# EAGLE design v6845-b (EAGLE 4.13)
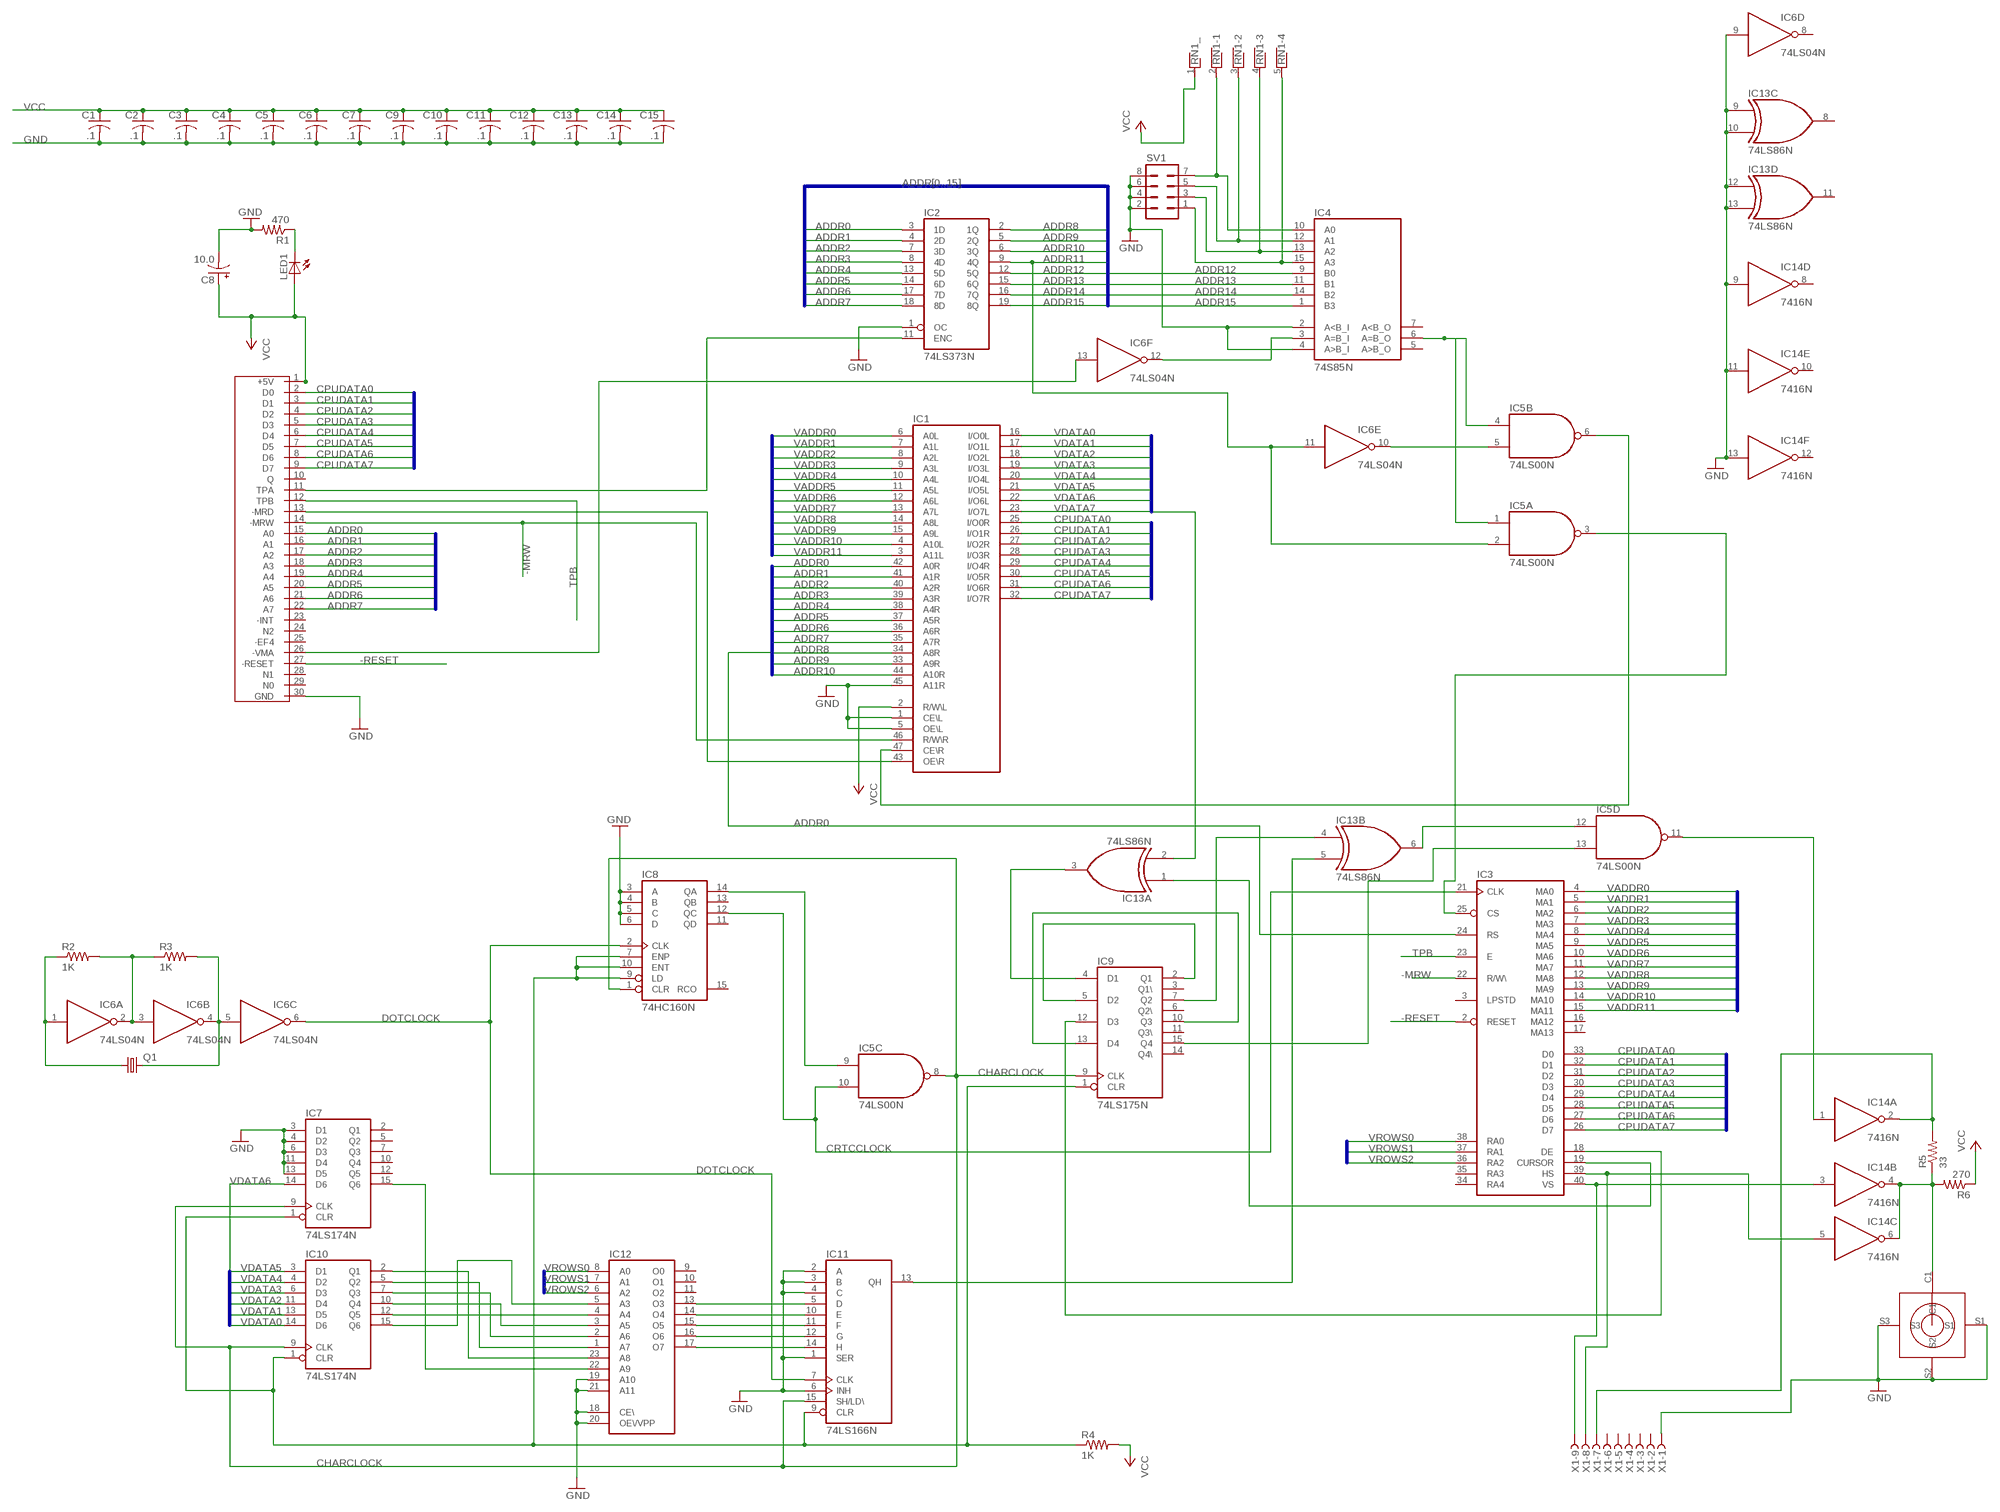
[diagram p0: schematic, sheet 1]

## Parts
C1  .1  C-US025-050X050  [C025-050X050]
C2  .1  C-US025-050X050  [C025-050X050]
C3  .1  C-US025-050X050  [C025-050X050]
C4  .1  C-US025-050X050  [C025-050X050]
C5  .1  C-US025-050X050  [C025-050X050]
C6  .1  C-US025-050X050  [C025-050X050]
C7  .1  C-US025-050X050  [C025-050X050]
C8  10.0  CPOL-USE2.5-7  [E2,5-7]
C9  .1  C-US025-050X050  [C025-050X050]
C10  .1  C-US025-050X050  [C025-050X050]
C11  .1  C-US025-050X050  [C025-050X050]
C12  .1  C-US025-050X050  [C025-050X050]
C13  .1  C-US025-050X050  [C025-050X050]
C14  .1  C-US025-050X050  [C025-050X050]
C15  .1  C-US025-050X050  [C025-050X050]
IC1  7134P  [DIL48]
IC2  74LS373N  [DIL20]
IC3  6845  [DIL40]
IC4  74S85N  [DIL16]
IC5  74LS00N  [DIL14]
IC6  74LS04N  [DIL14]
IC7  74LS174N  [DIL16]
IC8  74HC160N  [DIL16]
IC9  74LS175N  [DIL16]
IC10  74LS174N  [DIL16]
IC11  74LS166N  [DIL16]
IC12  2732  [DIL24]
IC13  74LS86N  [DIL14]
IC14  7416N  [DIL14]
LED1  LED5MM  [LED5MM]
Q1  CRYTALHC49U-V  [HC49U-V]
R1  470  R-US_0207/7  [0207/7]
R2  1K  R-US_0207/7  [0207/7]
R3  1K  R-US_0207/7  [0207/7]
R4  1K  R-US_0207/7  [0207/7]
R5  33  R-US_0207/7  [0207/7]
R6  270  R-US_0207/7  [0207/7]
RN1  RNX4  [RN-5]
SV1  MA04-2  [MA04-2]
U$1  C30  [C30]
U$4  RCA  [RCA]
X1  F09HPS  [F09HP]

## Nets
-MRW: IC1.46(R/W\R) IC3.22(R/W\) U$1.14(-MRW)
-RESET: IC3.2(RESET) U$1.27(-RESET)
ADDR0: IC1.42(A0R) IC2.3(1D) IC3.24(RS) U$1.15(A0)
ADDR1: IC1.41(A1R) IC2.4(2D) U$1.16(A1)
ADDR2: IC1.40(A2R) IC2.7(3D) U$1.17(A2)
ADDR3: IC1.39(A3R) IC2.8(4D) U$1.18(A3)
ADDR4: IC1.38(A4R) IC2.13(5D) U$1.19(A4)
ADDR5: IC1.37(A5R) IC2.14(6D) U$1.20(A5)
ADDR6: IC1.36(A6R) IC2.17(7D) U$1.21(A6)
ADDR7: IC1.35(A7R) IC2.18(8D) U$1.22(A7)
ADDR8: IC1.34(A8R) IC2.2(1Q)
ADDR9: IC1.33(A9R) IC2.5(2Q)
ADDR10: IC1.44(A10R) IC2.6(3Q)
ADDR11: IC2.9(4Q) IC5.2(A:I1) IC6.11(E:I)
ADDR12: IC2.12(5Q) IC4.9(B0)
ADDR13: IC2.15(6Q) IC4.11(B1)
ADDR14: IC2.16(7Q) IC4.14(B2)
ADDR15: IC2.19(8Q) IC4.1(B3)
CHARCLOCK: IC5.8(C:O) IC7.9(CLK) IC8.1(CLR) IC9.9(CLK) IC10.9(CLK) IC11.15(SH/LD\)
CPUDATA0: IC1.25(I/O0R) IC3.33(D0) U$1.2(D0)
CPUDATA1: IC1.26(I/O1R) IC3.32(D1) U$1.3(D1)
CPUDATA2: IC1.27(I/O2R) IC3.31(D2) U$1.4(D2)
CPUDATA3: IC1.28(I/O3R) IC3.30(D3) U$1.5(D3)
CPUDATA4: IC1.29(I/O4R) IC3.29(D4) U$1.6(D4)
CPUDATA5: IC1.30(I/O5R) IC3.28(D5) U$1.7(D5)
CPUDATA6: IC1.31(I/O6R) IC3.27(D6) U$1.8(D6)
CPUDATA7: IC1.32(I/O7R) IC3.26(D7) U$1.9(D7)
CRTCCLOCK: IC3.21(CLK) IC5.10(C:I1) IC8.12(QC)
DOTCLOCK: IC6.6(C:O) IC8.2(CLK) IC11.7(CLK)
GND: C1.2 C2.2 C3.2 C4.2 C5.2 C6.2 C7.2 C8.- C9.2 C10.2 C11.2 C12.2 C13.2 C14.2 C15.2 IC1.1(CE\L) IC1.5(OE\L) IC1.45(A11R) IC2.1(OC) IC4.2(A<B_I) IC4.4(A>B_I) IC6.9(D:I) IC7.3(D1) IC7.4(D2) IC7.6(D3) IC7.11(D4) IC7.13(D5) IC8.3(A) IC8.4(B) IC8.5(C) IC8.6(D) IC11.1(SER) IC11.2(A) IC11.3(B) IC11.4(C) IC11.6(INH) IC12.18(CE\) IC12.19(A10) IC12.20(OE\/VPP) IC12.21(A11) IC13.9(C:I0) IC13.10(C:I1) IC13.12(D:I0) IC13.13(D:I1) IC14.9(D:I) IC14.11(E:I) IC14.13(F:I) R1.2 SV1.2 SV1.4 SV1.6 SV1.8 U$1.30(GND) U$4.S1 U$4.S2 U$4.S3 X1.1
N$1: IC1.43(OE\R) U$1.13(-MRD)
N$2: IC5.5(B:I1) IC6.10(E:O)
N$3: IC3.25(CS) IC5.3(A:O)
N$4: IC4.10(A0) RN1.2 SV1.7
N$5: IC4.12(A1) RN1.3 SV1.5
N$6: IC4.13(A2) RN1.4 SV1.3
N$7: IC4.15(A3) RN1.5 SV1.1
N$8: IC4.3(A=B_I) IC6.12(F:O)
N$9: IC1.47(CE\R) IC5.6(B:O)
N$10: IC7.1(CLR) IC8.7(ENP) IC8.9(LD) IC8.10(ENT) IC9.1(CLR) IC10.1(CLR) IC11.9(CLR) R4.1
N$11: IC6.4(B:O) IC6.5(C:I) Q1.2 R3.2
N$12: IC6.1(A:I) Q1.1 R2.1
N$13: IC7.15(Q6) IC12.22(A9)
N$14: IC6.2(A:O) IC6.3(B:I) R2.2 R3.1
N$17: IC3.19(CURSOR) IC13.1(A:I0)
N$20: IC5.9(C:I0) IC8.14(QA)
N$21: IC9.4(D1) IC13.3(A:O)
N$22: LED1.K(C) R1.1
N$23: IC9.2(Q1) IC9.5(D2)
N$24: IC11.5(D) IC12.13(O3)
N$25: IC11.10(E) IC12.14(O4)
N$26: IC11.11(F) IC12.15(O5)
N$27: IC11.12(G) IC12.16(O6)
N$28: IC11.14(H) IC12.17(O7)
N$29: IC10.2(Q1) IC12.23(A8)
N$30: IC10.5(Q2) IC12.1(A7)
N$31: IC10.7(Q3) IC12.2(A6)
N$32: IC10.10(Q4) IC12.3(A5)
N$33: IC10.12(Q5) IC12.4(A4)
N$34: IC10.15(Q6) IC12.5(A3)
N$35: IC9.7(Q2) IC13.4(B:I0)
N$36: IC11.13(QH) IC13.5(B:I1)
N$37: IC9.10(Q3) IC9.13(D4)
N$38: IC3.18(DE) IC9.12(D3)
N$39: IC5.12(D:I0) IC13.6(B:O)
N$40: IC5.13(D:I1) IC9.15(Q4)
N$41: IC3.40(VS) IC14.3(B:I) X1.9
N$42: IC3.39(HS) IC14.5(C:I) X1.8
N$43: IC5.11(D:O) IC14.1(A:I)
N$44: IC14.4(B:O) IC14.6(C:O) R5.1 R6.2 U$4.C1
N$45: IC14.2(A:O) R5.2 X1.7
N$46: IC4.6(A=B_O) IC5.1(A:I0) IC5.4(B:I0)
N$47: IC6.13(F:I) U$1.26(-VMA)
TPA: IC2.11(ENC) U$1.11(TPA)
TPB: IC3.23(E) U$1.12(TPB)
VADDR0: IC1.6(A0L) IC3.4(MA0)
VADDR1: IC1.7(A1L) IC3.5(MA1)
VADDR2: IC1.8(A2L) IC3.6(MA2)
VADDR3: IC1.9(A3L) IC3.7(MA3)
VADDR4: IC1.10(A4L) IC3.8(MA4)
VADDR5: IC1.11(A5L) IC3.9(MA5)
VADDR6: IC1.12(A6L) IC3.10(MA6)
VADDR7: IC1.13(A7L) IC3.11(MA7)
VADDR8: IC1.14(A8L) IC3.12(MA8)
VADDR9: IC1.15(A9L) IC3.13(MA9)
VADDR10: IC1.4(A10L) IC3.14(MA10)
VADDR11: IC1.3(A11L) IC3.15(MA11)
VCC: C1.1 C2.1 C3.1 C4.1 C5.1 C6.1 C7.1 C8.+ C9.1 C10.1 C11.1 C12.1 C13.1 C14.1 C15.1 IC1.2(R/W\L) LED1.A R4.2 R6.1 RN1.1 U$1.1(+5V)
VDATA0: IC1.16(I/O0L) IC10.14(D6)
VDATA1: IC1.17(I/O1L) IC10.13(D5)
VDATA2: IC1.18(I/O2L) IC10.11(D4)
VDATA3: IC1.19(I/O3L) IC10.6(D3)
VDATA4: IC1.20(I/O4L) IC10.4(D2)
VDATA5: IC1.21(I/O5L) IC10.3(D1)
VDATA6: IC1.22(I/O6L) IC7.14(D6)
VDATA7: IC1.23(I/O7L) IC13.2(A:I1)
VROWS0: IC3.38(RA0) IC12.8(A0)
VROWS1: IC3.37(RA1) IC12.7(A1)
VROWS2: IC3.36(RA2) IC12.6(A2)
Unconnected: IC3.3(LPSTD) IC3.16(MA12) IC3.17(MA13) IC3.34(RA4) IC3.35(RA3) IC4.5(A>B_O) IC4.7(A<B_O) IC6.8(D:O) IC7.2(Q1) IC7.5(Q2) IC7.7(Q3) IC7.10(Q4) IC7.12(Q5) IC8.11(QD) IC8.13(QB) IC8.15(RCO) IC9.3(Q1\) IC9.6(Q2\) IC9.11(Q3\) IC9.14(Q4\) IC12.9(O0) IC12.10(O1) IC12.11(O2) IC13.8(C:O) IC13.11(D:O) IC14.8(D:O) IC14.10(E:O) IC14.12(F:O) U$1.10(Q) U$1.23(-INT) U$1.24(N2) U$1.25(-EF4) U$1.28(N1) U$1.29(N0) X1.2 X1.3 X1.4 X1.5 X1.6

## Buses
VADDR[0..11]
VDATA[0..7]
CPUDATA[0..7]
ADDR[0..15]
VROWS[0..4]

## Power pins joined to a net without a drawn wire
GND: IC1.24(GND) IC2.10(GND) IC3.1(GND) IC4.8(GND) IC5.7(P:GND) IC6.7(P:GND) IC7.8(GND) IC8.8(GND) IC9.8(GND) IC10.8(GND) IC11.8(GND) IC12.12(GND) IC13.7(P:GND) IC14.7(P:GND)
VCC: IC1.48(VCC) IC2.20(VCC) IC3.20(VCC) IC4.16(VCC) IC5.14(P:VCC) IC6.14(P:VCC) IC7.16(VCC) IC8.16(VCC) IC9.16(VCC) IC10.16(VCC) IC11.16(VCC) IC12.24(VCC) IC13.14(P:VCC) IC14.14(P:VCC)

## Library data of the parts
C1-C7 C9-C15 = rcl:C-US: CAPACITOR, American symbol
C8 = rcl:CPOL-US: POLARIZED CAPACITOR, American symbol
IC1 = memory-idt:7134P: MEMORY
IC2 = 74xx-us:74*373: Octal D type transparent LATCH, edge triggered
IC3 = micro-motorola:6845: MICROCONTROLLER/MEMORY DEVICE
IC4 = 74xx-us:74*85: 4-bit magnitude COMPARATOR
IC5 = 74xx-us:74*00: Quad 2-input NAND gate
IC6 = 74xx-us:74*04: Hex INVERTER
IC7 IC10 = 74xx-us:74*174: Hex D type FLIP FLOP, clear
IC8 = 74xx-eu:74*160: Synchronous 4-bit COUNTER
IC9 = 74xx-us:74*175: Qadruple D type FLIP FLOP, clear
IC11 = 74xx-us:74*166: 8-bit parallel load SHIFT REGISTER
IC12 = memory:2732: MEMORY
IC13 = 74xx-us:74*86: Quad 2-input EXCLUSIV-OR (XOR) gate
IC14 = 74xx-us:74*16: Hex INVERTER, open collector, high-voltage
LED1 = led:LED: LED OSRAM: - CHIPLED LG R971, LG N971, LY N971, LG Q971, LY Q971, LO R971, LY R971 LH N974, LH R974 LS Q976, LO Q976, LY Q976 LO Q996 - Hyper CHIPLED LW Q18S LB Q993, LB Q99A, LB R99A - SideLED LS A670, LO A670, LY A670, LG A670, LP A670 LB A673, LV A673, LT A673, LW A673 LH A674 LY A675 LS A676, LA A676, LO A676, LY A676, LW A676 LS A679, LY A679, LG A679 - Hyper Micro SIDELED® LS Y876, LA Y876, LO Y876, LY Y876 LT Y87S - SmartLED LW L88C, LW L88S LB L89C, LB L89S, LG L890 LS L89K, LO L89K, LY L89K LS L896, LA L896, LO L896, LY L896 - TOPLED LS T670, LO T670, LY T670, LG T670, LP T670 LSG T670, LSP T670, LSY T670, LOP T670, LYG T670 LG T671, LOG T671, LSG T671 LB T673, LV T673, LT T673, LW T673 LH T674 LS T676, LA T676, LO T676, LY T676, LB T676, LH T676, LSB T676, LW T676 LB T67C, LV T67C, LT T67C, LS T67K, LO T67K, LY T67K, LW E67C LS E67B, LA E67B, LO E67B, LY E67B, LB E67C, LV E67C, LT E67C LW T67C LS T679, LY T679, LG T679 LS T770, LO T770, LY T770, LG T770, LP T770 LB T773, LV T773, LT T773, LW T773 LH T774 LS E675, LA E675, LY E675, LS T675 LS T776, LA T776, LO T776, LY T776, LB T776 LHGB T686 LT T68C, LB T68C - Hyper Mini TOPLED® LB M676 - Mini TOPLED Santana® LG M470 LS M47K, LO M47K, LY M47K Source: http://www.osram.convergy.de/
Q1 = crystal:CRYTAL: CRYSTAL
R1-R6 = rcl:R-US_: RESISTOR, American symbol
RN1 = resistor-net:RNX4: RESISTOR NETWORK
SV1 = con-lstb:MA04-2: PIN HEADER
U$1 = k1:C30
U$4 = cdp:RCA
X1 = con-subd:F09?S: SUB-D

## Board
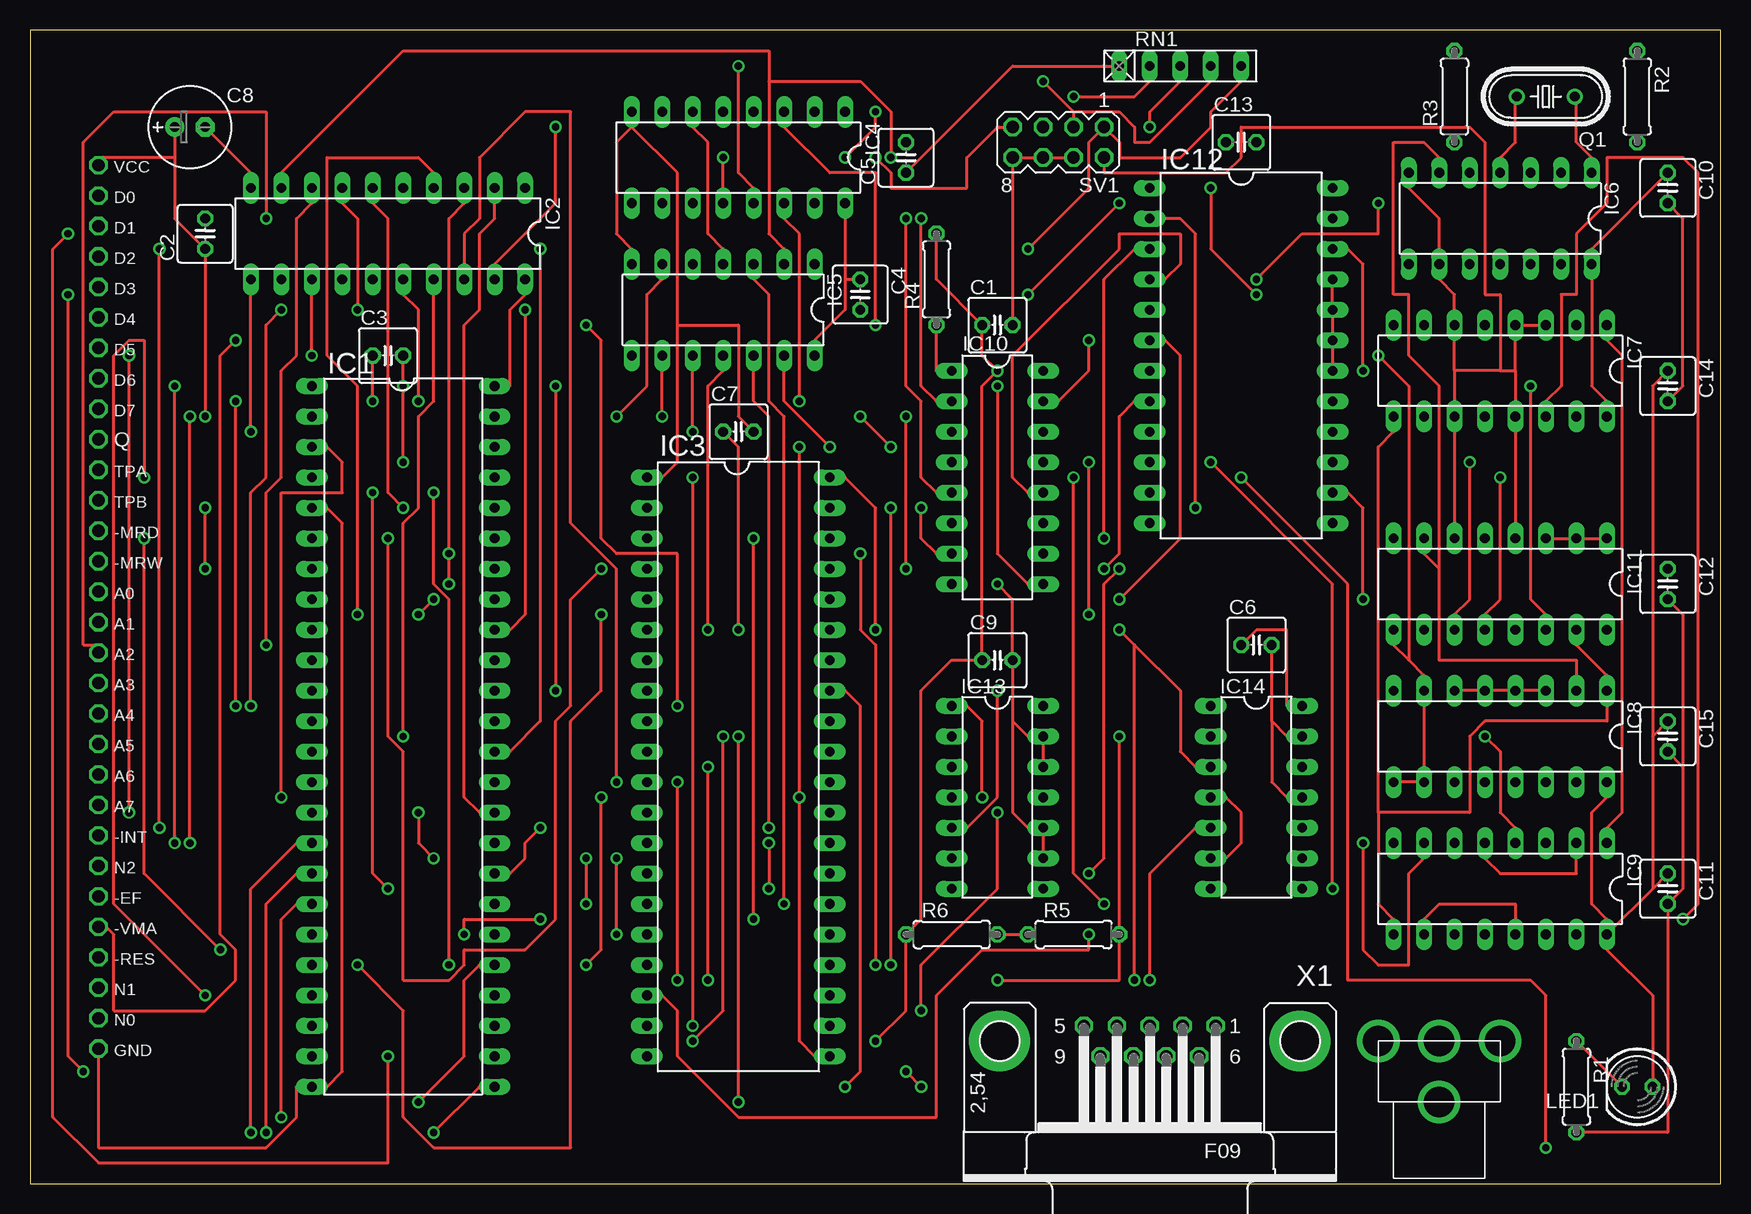
[diagram p1: board, top side]
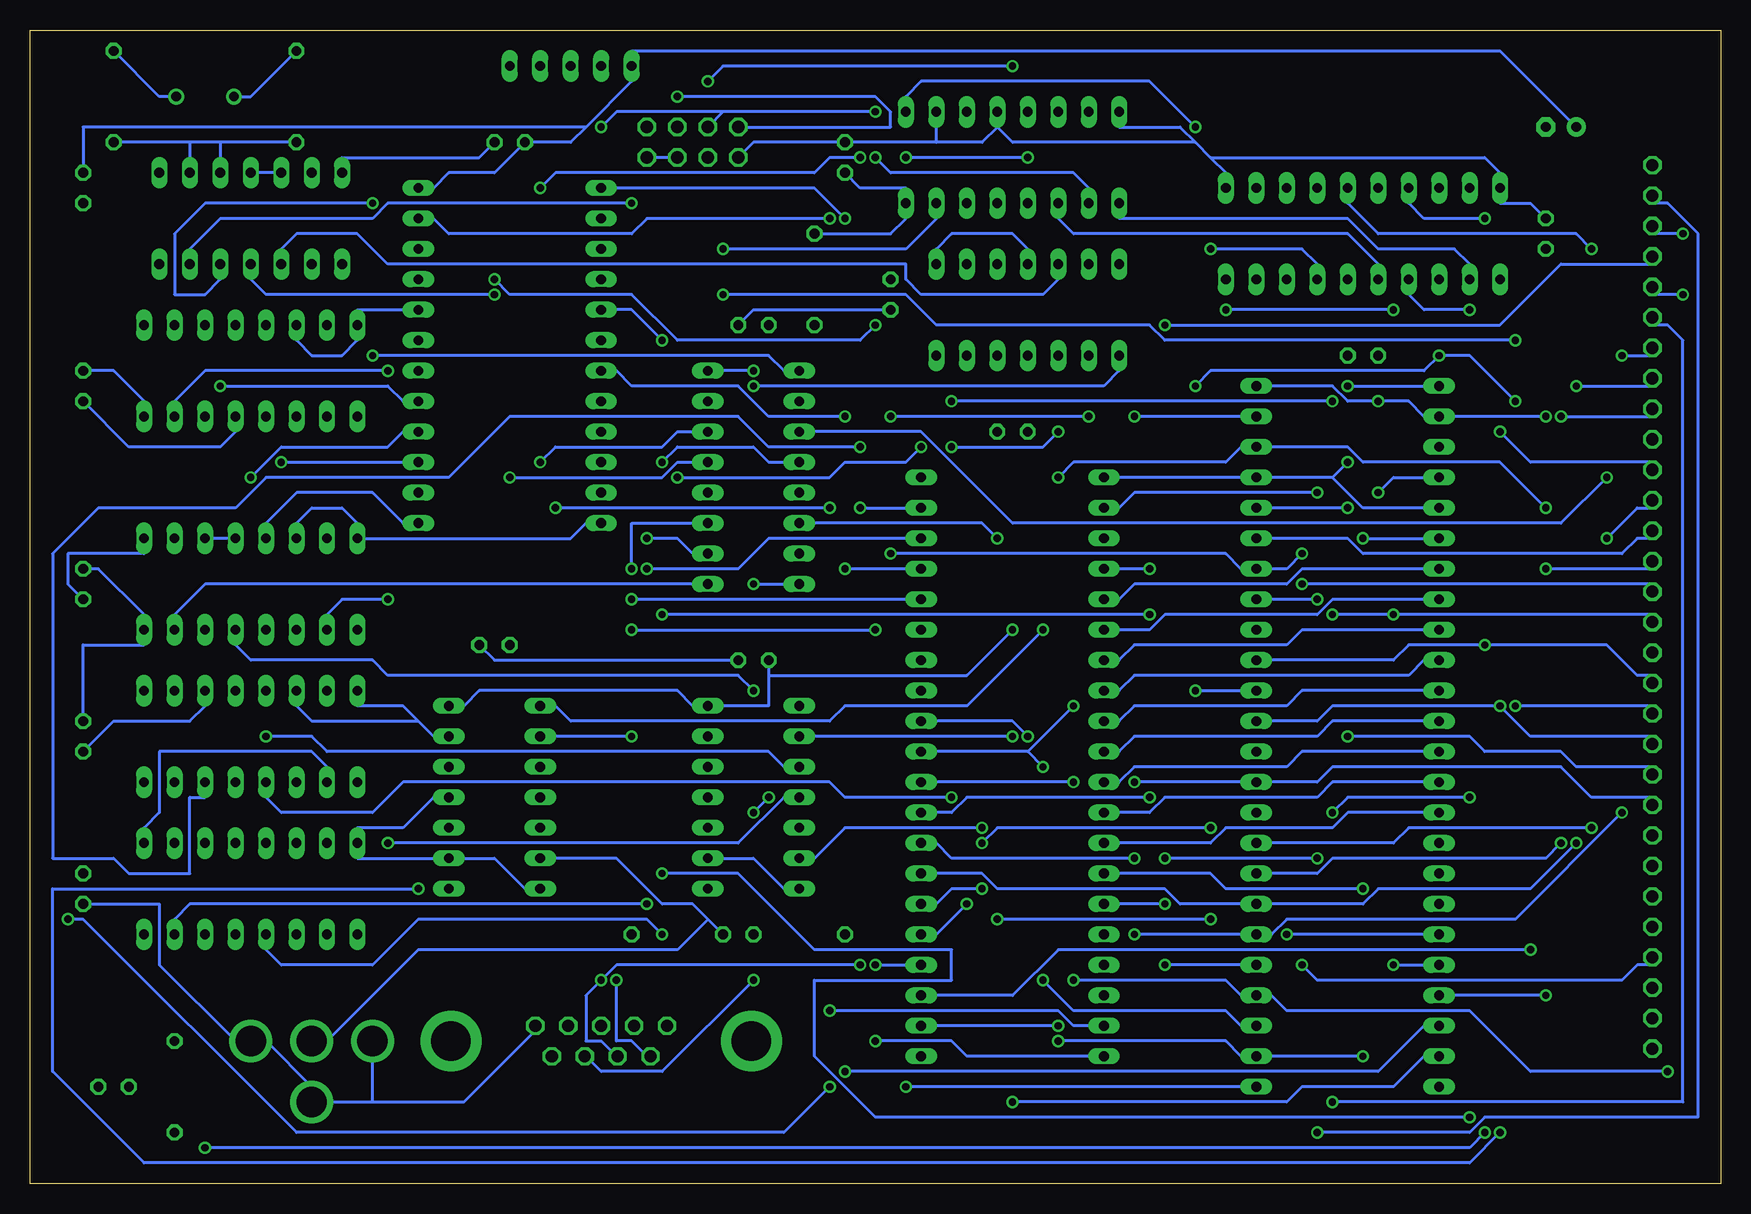
[diagram p2: board, bottom side, seen from below]

Size 140.95 x 96.19 mm. Coordinates in mm from the lower left corner, seen from the top.
Outline: 0,0 140.95,0 140.95,96.19 0,96.19 0,0
Copper layers (1*16): Top 0.035mm / dielectric 1.5mm / Bottom 0.035mm
Design rules "default": minimum track width 10mil, minimum drill 24mil, track to track 8mil, track to pad 8mil, pad to pad 8mil, via to via 8mil, smd to smd 8mil, copper to edge 40mil, drill to drill 8mil, minimum pad ring 10mil, minimum via ring 8mil, stop-mask expansion 4mil, vias tented up to drill 0mil, thermal gap 10mil
tRestrict: area 109.8,0.5 to 125.1,15.7; area 76.8,0.5 to 109.8,15.7

### Footprints (pad centres in the part's own frame; a part is rotated, then mirrored left to right if it is on the bottom)
C025-050X050 = drill 0.813 octagon: 1 -1.27,0; 2 1.27,0
E2,5-7 = drill 0.813 pad 1.6 round: + -1.27,0 | drill 0.813 pad 1.6 octagon: - 1.27,0
DIL48 = drill 0.813 long: 1 -29.21,-7.62; 2 -26.67,-7.62; 3 -24.13,-7.62; 4 -21.59,-7.62; 5 -19.05,-7.62; 6 -16.51,-7.62; 7 -13.97,-7.62; 8 -11.43,-7.62; 9 -8.89,-7.62; 10 -6.35,-7.62; 11 -3.81,-7.62; 12 -1.27,-7.62; 13 1.27,-7.62; 14 3.81,-7.62; 15 6.35,-7.62; 16 8.89,-7.62; 17 11.43,-7.62; 18 13.97,-7.62; 19 16.51,-7.62; 20 19.05,-7.62; 21 21.59,-7.62; 22 24.13,-7.62; 23 26.67,-7.62; 24 29.21,-7.62; 25 29.21,7.62; 26 26.67,7.62; 27 24.13,7.62; 28 21.59,7.62; 29 19.05,7.62; 30 16.51,7.62; 31 13.97,7.62; 32 11.43,7.62; 33 8.89,7.62; 34 6.35,7.62; 35 3.81,7.62; 36 1.27,7.62; 37 -1.27,7.62; 38 -3.81,7.62; 39 -6.35,7.62; 40 -8.89,7.62; 41 -11.43,7.62; 42 -13.97,7.62; 43 -16.51,7.62; 44 -19.05,7.62; 45 -21.59,7.62; 46 -24.13,7.62; 47 -26.67,7.62; 48 -29.21,7.62
DIL20 = drill 0.813 long: 1 -11.43,-3.81; 2 -8.89,-3.81; 3 -6.35,-3.81; 4 -3.81,-3.81; 5 -1.27,-3.81; 6 1.27,-3.81; 7 3.81,-3.81; 8 6.35,-3.81; 9 8.89,-3.81; 10 11.43,-3.81; 11 11.43,3.81; 12 8.89,3.81; 13 6.35,3.81; 14 3.81,3.81; 15 1.27,3.81; 16 -1.27,3.81; 17 -3.81,3.81; 18 -6.35,3.81; 19 -8.89,3.81; 20 -11.43,3.81
DIL40 = drill 0.813 long: 1 -24.13,-7.62; 2 -21.59,-7.62; 3 -19.05,-7.62; 4 -16.51,-7.62; 5 -13.97,-7.62; 6 -11.43,-7.62; 7 -8.89,-7.62; 8 -6.35,-7.62; 9 -3.81,-7.62; 10 -1.27,-7.62; 11 1.27,-7.62; 12 3.81,-7.62; 13 6.35,-7.62; 14 8.89,-7.62; 15 11.43,-7.62; 16 13.97,-7.62; 17 16.51,-7.62; 18 19.05,-7.62; 19 21.59,-7.62; 20 24.13,-7.62; 21 24.13,7.62; 22 21.59,7.62; 23 19.05,7.62; 24 16.51,7.62; 25 13.97,7.62; 26 11.43,7.62; 27 8.89,7.62; 28 6.35,7.62; 29 3.81,7.62; 30 1.27,7.62; 31 -1.27,7.62; 32 -3.81,7.62; 33 -6.35,7.62; 34 -8.89,7.62; 35 -11.43,7.62; 36 -13.97,7.62; 37 -16.51,7.62; 38 -19.05,7.62; 39 -21.59,7.62; 40 -24.13,7.62
DIL16 = drill 0.813 long: 1 -8.89,-3.81; 2 -6.35,-3.81; 3 -3.81,-3.81; 4 -1.27,-3.81; 5 1.27,-3.81; 6 3.81,-3.81; 7 6.35,-3.81; 8 8.89,-3.81; 9 8.89,3.81; 10 6.35,3.81; 11 3.81,3.81; 12 1.27,3.81; 13 -1.27,3.81; 14 -3.81,3.81; 15 -6.35,3.81; 16 -8.89,3.81
DIL14 = drill 0.813 long: 1 -7.62,-3.81; 2 -5.08,-3.81; 3 -2.54,-3.81; 4 0,-3.81; 5 2.54,-3.81; 6 5.08,-3.81; 7 7.62,-3.81; 8 7.62,3.81; 9 5.08,3.81; 10 2.54,3.81; 11 0,3.81; 12 -2.54,3.81; 13 -5.08,3.81; 14 -7.62,3.81
DIL24 = drill 0.813 long: 1 -13.97,-7.62; 2 -11.43,-7.62; 3 -8.89,-7.62; 4 -6.35,-7.62; 5 -3.81,-7.62; 6 -1.27,-7.62; 7 1.27,-7.62; 8 3.81,-7.62; 9 6.35,-7.62; 10 8.89,-7.62; 11 11.43,-7.62; 12 13.97,-7.62; 13 13.97,7.62; 14 11.43,7.62; 15 8.89,7.62; 16 6.35,7.62; 17 3.81,7.62; 18 1.27,7.62; 19 -1.27,7.62; 20 -3.81,7.62; 21 -6.35,7.62; 22 -8.89,7.62; 23 -11.43,7.62; 24 -13.97,7.62
LED5MM = drill 0.813 octagon: A -1.27,0; K 1.27,0
HC49U-V = drill 0.813 round: 1 -2.413,0; 2 2.413,0
0207/7 = drill 0.813 octagon: 1 -3.81,0; 2 3.81,0
RN-5 = drill 0.813 long: 1 -5.08,0; 2 -2.54,0; 3 0,0; 4 2.54,0; 5 5.08,0
MA04-2 = drill 1.016 octagon: 1 -3.81,-1.27; 2 -3.81,1.27; 3 -1.27,-1.27; 4 -1.27,1.27; 5 1.27,-1.27; 6 1.27,1.27; 7 3.81,-1.27; 8 3.81,1.27
C30 = drill 1.016 octagon: 1 -36.83,0; 2 -34.29,0; 3 -31.75,0; 4 -29.21,0; 5 -26.67,0; 6 -24.13,0; 7 -21.59,0; 8 -19.05,0; 9 -16.51,0; 10 -13.97,0; 11 -11.43,0; 12 -8.89,0; 13 -6.35,0; 14 -3.81,0; 15 -1.27,0; 16 1.27,0; 17 3.81,0; 18 6.35,0; 19 8.89,0; 20 11.43,0; 21 13.97,0; 22 16.51,0; 23 19.05,0; 24 21.59,0; 25 24.13,0; 26 26.67,0; 27 29.21,0; 28 31.75,0; 29 34.29,0; 30 36.83,0
RCA = drill 2.54 round: C1 5.08,0; S1 0,0; S2 5.08,5.08; S3 10.16,0
F09HP = drill 1.016 octagon: 1 -5.486,-1.27; 2 -2.743,-1.27; 3 0,-1.27; 4 2.743,-1.27; 5 5.486,-1.27; 6 -4.115,1.27; 7 -1.372,1.27; 8 1.372,1.27; 9 4.115,1.27 | drill 3.302 pad 5.08 round: G1 -12.522,0; G2 12.522,0

### Placement (x,y rotation side)
C1  80.64,71.59 0 top
C2  14.6,79.21 90 top
C3  29.84,69.05 0 top
C4  69.21,74.13 270 top
C5  73.02,85.56 90 top
C6  102.23,44.92 0 top
C7  59.05,62.7 0 top
C8  13.33,88.1 0 top
C9  80.64,43.65 0 top
C10  136.52,83.02 270 top
C11  136.52,24.6 270 top
C12  136.52,50 270 top
C13  100.96,86.83 0 top
C14  136.52,66.51 270 top
C15  136.52,37.3 270 top
IC1  31.11,37.3 270 top
IC2  29.84,79.21 180 top
IC3  59.05,34.76 270 top
IC4  59.05,85.56 180 top
IC5  57.78,72.86 180 top
IC6  122.55,80.48 180 top
IC7  122.55,67.78 180 top
IC8  122.55,37.3 180 top
IC9  122.55,24.6 180 top
IC10  80.64,58.89 270 top
IC11  122.55,50 180 top
IC12  100.96,69.05 270 top
IC13  80.64,32.22 270 top
IC14  102.23,32.22 270 top
LED1  133.98,8.09 180 top
Q1  126.36,90.64 180 top
R1  128.9,8.09 270 top
R2  133.98,90.64 270 top
R3  118.74,90.64 90 top
R4  75.56,75.4 90 top
R5  86.99,20.79 0 top
R6  76.83,20.79 0 top
RN1  95.88,93.18 0 top
SV1  85.72,86.83 180 top
U$1  5.71,48.09 270 top
U$4  122.55,11.9 180 top
X1  93.34,11.9 180 top

### Tracks (layer width: path | path; a pad name or v marks a point on that pad's centre or on a via)
-MRW  (via drill 0.61)
  Top 0.254: v55.24,58.89 v55.24,13.17 | v14.6,51.27 v14.6,56.35
  Bottom 0.254: v55.24,58.89 53.97,60.16 41.27,60.16 40,61.43 IC1.46 31.11,61.43 29.84,60.16 18.41,60.16 v14.6,56.35 | v55.24,13.17 IC3.22 | v14.6,51.27 5.71,51.27 U$1.14
-RESET  (via drill 0.61)
  Top 0.254: v33.65,57.62 33.65,50 34.92,48.73 v34.92,18.25
  Bottom 0.254: v33.65,57.62 48.89,57.62 50.16,56.35 IC3.2 | v34.92,18.25 33.65,16.98 8.25,16.98 6.98,18.25 5.71,18.25 U$1.27
ADDR0  (via drill 0.61)
  Top 0.254: v70.48,18.25 70.48,44.92 69.21,46.19 v69.21,52.54 | IC2.3 36.19,81.75 34.92,80.48 v34.92,52.54 v34.92,50
  Bottom 0.254: v69.21,52.54 41.27,52.54 40,51.27 IC1.42 36.19,51.27 v34.92,52.54 | v70.48,18.25 IC3.24 | v34.92,50 5.71,50 U$1.15
ADDR1  (via drill 0.61)
  Top 0.254: v32.38,47.46 v33.65,48.73 | v27.3,47.46 27.3,66.51 24.76,69.05 24.76,85.56 32.38,85.56 33.65,84.29 IC2.4
  Bottom 0.254: v32.38,47.46 v27.3,47.46 5.71,47.46 U$1.16 | v33.65,48.73 IC1.41
ADDR2  (via drill 0.61)
  Top 0.254: v41.27,72.86 41.27,47.46 40,46.19 IC1.40 | v27.3,72.86 27.3,80.48 26.03,81.75 IC2.7 | v19.68,80.48 19.68,89.37 6.98,89.37 4.44,86.83 4.44,44.92 5.71,44.92 U$1.17
  Bottom 0.254: v27.3,72.86 v41.27,72.86 | v19.68,80.48 24.76,80.48 26.03,81.75 IC2.7
ADDR3  (via drill 0.61)
  Top 0.254: v19.68,44.92 19.68,57.62 20.95,58.89 20.95,67.78 22.22,69.05 22.22,80.48 23.49,81.75 IC2.8
  Bottom 0.254: IC1.39 27.3,43.65 26.03,44.92 v19.68,44.92 9.52,44.92 6.98,42.38 5.71,42.38 U$1.18
ADDR4  (via drill 0.61)
  Top 0.254: v43.81,66.51 v43.81,41.11 | v23.49,69.05 IC2.13 | v17.14,39.84 v17.14,65.24
  Bottom 0.254: v43.81,66.51 42.54,67.78 24.76,67.78 v23.49,69.05 20.95,69.05 v17.14,65.24 | v43.81,41.11 IC1.38 | v17.14,39.84 5.71,39.84 U$1.19
ADDR5  (via drill 0.61)
  Top 0.254: v20.95,72.86 19.68,71.59 19.68,58.89 18.41,57.62 v18.41,39.84
  Bottom 0.254: IC1.37 33.65,38.57 32.38,39.84 v18.41,39.84 15.87,37.3 5.71,37.3 U$1.20 | v20.95,72.86 24.76,72.86 26.03,74.13 IC2.14
ADDR6  (via drill 0.61)
  Top 0.254: v42.54,77.94 42.54,38.57 40,36.03 IC1.36 | v31.11,37.3 31.11,55.08 32.38,56.35 32.38,63.97 33.65,65.24 IC2.17
  Bottom 0.254: v42.54,77.94 34.92,77.94 33.65,76.67 IC2.17 | v31.11,37.3 20.95,37.3 19.68,36.03 13.33,36.03 12.06,34.76 5.71,34.76 U$1.21
ADDR7  (via drill 0.61)
  Top 0.254: v48.89,33.49 48.89,51.27 45.08,55.08 45.08,89.37 41.27,89.37 37.46,85.56 37.46,80.48 36.19,79.21 IC2.18
  Bottom 0.254: U$1.22 5.71,32.22 10.79,32.22 13.33,34.76 32.38,34.76 33.65,33.49 IC1.35 v48.89,33.49
ADDR8
  Top 0.254: IC1.34 37.46,30.95 36.19,32.22 36.19,71.59 37.46,72.86 37.46,79.21 38.73,80.48 IC2.2
ADDR9  (via drill 0.61)
  Top 0.254: v10.79,29.68 v10.79,77.94
  Bottom 0.254: v10.79,29.68 26.03,29.68 27.3,28.41 IC1.33 | v10.79,77.94 12.06,79.21 28.57,79.21 31.11,81.75 IC2.5
ADDR10  (via drill 0.61)
  Top 0.254: v31.11,56.35 29.84,57.62 29.84,80.48 28.57,81.75 IC2.6
  Bottom 0.254: v31.11,56.35 IC1.44
ADDR11  (via drill 0.61)
  Top 0.254: 61.59,91.91 61.59,79.21 62.86,77.94 IC5.2 | 61.59,91.91 61.59,94.45 31.11,94.45 20.95,84.29 IC2.9 | v102.23,74.13 98.42,77.94 v98.42,83.02 | v71.75,85.56 71.75,89.37 69.21,91.91 61.59,91.91
  Bottom 0.254: v102.23,74.13 121.28,74.13 122.55,75.4 IC6.11 | v98.42,83.02 97.15,84.29 75.56,84.29 74.29,85.56 v71.75,85.56
ADDR12
  Bottom 0.254: IC2.12 20.95,76.67 22.22,77.94 28.57,77.94 31.11,80.48 50.16,80.48 IC4.9
ADDR13
  Bottom 0.254: IC2.15 28.57,76.67 31.11,79.21 53.97,79.21 55.24,80.48 IC4.11
ADDR14  (via drill 0.61)
  Top 0.254: v32.38,65.24 32.38,72.86 31.11,74.13 IC2.16 | v64.13,65.24 64.13,79.21 62.86,80.48 IC4.14
  Bottom 0.254: v32.38,65.24 v64.13,65.24
ADDR15  (via drill 0.61)
  Top 0.254: v43.81,88.1 43.81,81.75 38.73,76.67 IC2.19
  Bottom 0.254: v43.81,88.1 47.62,91.91 66.67,91.91 67.94,90.64 IC4.1
CHARCLOCK  (via drill 0.61)
  Top 0.254: 112.39,30.95 112.39,61.43 113.66,62.7 IC7.9 | 112.39,30.95 112.39,23.33 113.66,22.06 IC9.9 | IC11.15 128.9,44.92 131.44,42.38 IC8.1 131.44,38.57 121.28,38.57 120.01,37.3 120.01,30.95 112.39,30.95 | v80.64,66.51 80.64,52.54 83.18,50 IC10.9
  Bottom 0.254: IC10.9 126.36,50 128.9,47.46 IC11.15 | v80.64,66.51 51.43,66.51 50.16,67.78 IC5.8
CPUDATA0  (via drill 0.61)
  Top 0.254: v67.94,8.09 69.21,9.36 69.21,39.84 67.94,41.11 IC3.33 | v33.65,4.28 37.46,8.09 IC1.25
  Bottom 0.254: IC1.25 v67.94,8.09 | v33.65,4.28 20.95,4.28 19.68,5.55 1.9,5.55 1.9,79.21 4.44,81.75 5.71,81.75 U$1.2
CPUDATA1  (via drill 0.61)
  Top 0.254: v55.24,11.9 57.78,14.44 v57.78,37.3 | v3.17,79.21 1.9,77.94 1.9,5.55 5.71,1.74 29.84,1.74 v29.84,10.63
  Bottom 0.254: v55.24,11.9 41.27,11.9 40,10.63 IC1.26 v29.84,10.63 | v57.78,37.3 59.05,38.57 IC3.32 | v3.17,79.21 5.71,79.21 U$1.3
CPUDATA2  (via drill 0.61)
  Top 0.254: v56.51,16.98 v56.51,34.76 | v46.35,71.59 47.62,70.32 47.62,53.81 48.89,52.54 53.97,52.54 v53.97,39.84
  Bottom 0.254: v56.51,16.98 53.97,14.44 41.27,14.44 40,13.17 IC1.27 | v56.51,34.76 57.78,36.03 | 57.78,36.03 IC3.31 | v46.35,71.59 18.41,71.59 13.33,76.67 5.71,76.67 U$1.4 | 57.78,36.03 v53.97,39.84
CPUDATA3  (via drill 0.61)
  Top 0.254: v53.97,16.98 v53.97,33.49 | v3.17,74.13 3.17,10.63 v4.44,9.36
  Bottom 0.254: v53.97,16.98 41.27,16.98 40,15.71 IC1.28 37.46,15.71 36.19,14.44 20.95,14.44 15.87,9.36 v4.44,9.36 | v53.97,33.49 IC3.30 | v3.17,74.13 5.71,74.13 U$1.5
CPUDATA4  (via drill 0.61)
  Top 0.254: v46.35,18.25 47.62,19.52 v47.62,32.22 | v32.38,6.82 36.19,10.63 36.19,16.98 37.46,18.25 IC1.29
  Bottom 0.254: v47.62,32.22 62.86,32.22 64.13,30.95 IC3.29 | IC1.29 v46.35,18.25 | v32.38,6.82 3.17,6.82 3.17,70.32 4.44,71.59 5.71,71.59 U$1.6
CPUDATA5  (via drill 0.61)
  Top 0.254: v48.89,20.79 v48.89,27.14 | v8.25,30.95 v8.25,69.05
  Bottom 0.254: v48.89,27.14 64.13,27.14 65.4,28.41 IC3.28 | v48.89,20.79 IC1.30 37.46,20.79 36.19,22.06 17.14,22.06 v8.25,30.95 | v8.25,69.05 5.71,69.05 U$1.7
CPUDATA6  (via drill 0.61)
  Top 0.254: v12.06,28.41 v12.06,66.51
  Bottom 0.254: IC3.27 61.59,25.87 60.32,24.6 46.35,24.6 45.08,23.33 IC1.31 29.84,23.33 28.57,24.6 15.87,24.6 v12.06,28.41 | v12.06,66.51 5.71,66.51 U$1.8
CPUDATA7  (via drill 0.61)
  Top 0.254: v61.59,28.41 v61.59,24.6 | v42.54,29.68 41.27,28.41 41.27,27.14 40,25.87 IC1.32 | v13.33,28.41 v13.33,63.97
  Bottom 0.254: v61.59,24.6 64.13,24.6 65.4,23.33 IC3.26 | v61.59,28.41 60.32,29.68 v42.54,29.68 | v13.33,63.97 5.71,63.97 U$1.9 | v13.33,28.41 14.6,27.14 32.38,27.14 33.65,25.87 IC1.32
CRTCCLOCK  (via drill 0.61)
  Top 0.254: IC3.21 65.4,10.63 64.13,11.9 v64.13,32.22 v64.13,61.43 | v55.24,62.7 IC5.10
  Bottom 0.254: v64.13,32.22 73.02,32.22 74.29,33.49 109.85,33.49 112.39,30.95 120.01,30.95 121.28,32.22 IC8.12 | v55.24,62.7 56.51,61.43 v64.13,61.43
DOTCLOCK
  Top 0.254: 117.47,51.27 116.2,52.54 IC11.7 | 117.47,51.27 117.47,43.65 128.9,43.65 IC8.2 | 117.47,51.27 117.47,66.51 114.93,69.05 114.93,74.13 113.66,74.13 113.66,86.83 116.2,86.83 117.47,85.56 IC6.6
GND  (via drill 0.61)
  Top 0.254: IC11.3 IC11.2 IC11.1 | 123.82,67.78 IC7.13 IC11.4 | 123.82,67.78 IC7.4 IC7.3 | C10.2 137.79,80.48 137.79,66.51 C14.2 | IC12.18 IC12.19 IC12.20 IC12.21 | 118.74,67.78 IC7.11 IC11.6 | 118.74,67.78 IC7.6 118.74,74.13 117.47,75.4 IC6.9 117.47,80.48 114.93,83.02 IC6.7 | 122.55,67.78 118.74,67.78 | 122.55,67.78 123.82,67.78 | R1.2 136.52,4.28 C11.2 137.79,24.6 137.79,34.76 | IC8.6 IC8.5 IC8.4 IC8.3 | IC13.9 IC13.10 83.18,29.68 81.91,30.95 81.91,38.57 | IC13.12 IC13.13 83.18,37.3 81.91,38.57 | 81.91,38.57 C9.2 81.91,48.73 v80.64,50 | 103.5,38.57 104.77,37.3 IC14.13 | 103.5,38.57 C6.2 | 103.5,38.57 103.5,33.49 104.77,32.22 IC14.11 | 137.79,34.76 C15.2 | C12.2 137.79,47.46 137.79,34.76 | SV1.4 SV1.6 SV1.8 C1.2 | C8.- 18.41,84.29 IC2.10 | 50.16,88.1 48.89,86.83 48.89,79.21 50.16,77.94 IC5.7 | U$1.30 5.71,3.01 19.68,3.01 22.22,5.55 22.22,8.09 IC1.24 24.76,8.09 26.03,9.36 26.03,55.08 24.76,56.35 IC1.5 | C3.2 v31.11,66.51 v31.11,60.16 | C7.2 59.05,63.97 59.05,71.59 53.97,71.59 | 53.97,71.59 53.97,60.16 52.7,58.89 IC3.1 | 50.16,88.1 53.97,84.29 53.97,71.59 | 50.16,88.1 IC4.8 | 122.55,67.78 122.55,74.13 121.28,74.13 121.28,86.83 120.01,88.1 100.96,88.1 100.96,85.56 99.69,84.29 89.53,84.29 SV1.2
  Bottom 0.254: IC11.4 IC11.3 | C12.2 137.79,50 137.79,52.54 131.44,52.54 IC11.1 | C14.2 132.71,61.43 125.09,61.43 123.82,62.7 IC7.13 | IC11.6 118.74,55.08 117.47,56.35 114.93,56.35 113.66,55.08 IC11.8 95.88,53.81 94.61,55.08 IC12.12 | IC12.20 113.66,72.86 IC7.8 113.66,70.32 114.93,69.05 117.47,69.05 118.74,70.32 IC7.6 | C13.2 103.5,85.56 114.93,85.56 IC6.7 | 112.39,6.82 104.77,6.82 98.42,13.17 X1.1 | 112.39,6.82 U$4.S2 117.47,8.09 121.28,11.9 U$4.S1 123.82,11.9 130.17,18.25 130.17,23.33 C11.2 | 112.39,6.82 U$4.S3 | C15.2 133.98,38.57 127.63,38.57 126.36,39.84 IC8.3 | IC14.7 99.69,24.6 102.23,27.14 IC14.9 113.66,27.14 IC9.8 113.66,29.68 109.85,29.68 107.31,32.22 IC14.11 | IC13.7 78.1,24.6 80.64,27.14 IC13.9 | 108.58,38.57 109.85,39.84 113.66,39.84 IC8.8 | 108.58,38.57 107.31,37.3 IC14.13 | C6.2 102.23,43.65 C9.2 | v80.64,50 IC10.8 | 108.58,38.57 117.47,38.57 118.74,39.84 IC8.6 | C4.2 80.64,72.86 C1.2 | SV1.4 SV1.2 | 60.32,88.1 61.59,86.83 65.4,86.83 | 65.4,86.83 C5.2 80.64,86.83 SV1.8 | 65.4,86.83 IC4.2 | C2.2 15.87,81.75 18.41,81.75 IC2.10 18.41,84.29 19.68,85.56 42.54,85.56 | 43.81,86.83 45.08,88.1 50.16,88.1 IC4.8 | 43.81,86.83 42.54,85.56 | 42.54,85.56 41.27,84.29 IC2.1 | 60.32,88.1 59.05,86.83 43.81,86.83 | 60.32,88.1 IC4.4 | v31.11,66.51 IC1.1 | 32.38,58.89 29.84,56.35 IC1.5 | 32.38,58.89 IC1.45 IC3.1 | 32.38,58.89 v31.11,60.16
N$1
  Bottom 0.254: IC1.43 31.11,53.81 29.84,52.54 8.25,52.54 6.98,53.81 5.71,53.81 U$1.13
N$2
  Bottom 0.254: IC5.5 55.24,75.4 56.51,74.13 66.67,74.13 67.94,75.4 67.94,76.67 111.12,76.67 113.66,79.21 118.74,79.21 120.01,77.94 IC6.10
N$3  (via drill 0.61)
  Top 0.254: v62.86,23.33 62.86,63.97 61.59,65.24 61.59,74.13 60.32,75.4 IC5.3
  Bottom 0.254: v62.86,23.33 65.4,20.79 IC3.25
N$4  (via drill 0.61)
  Top 0.254: v70.48,85.56 71.75,84.29 71.75,83.02 78.1,83.02 78.1,85.56 80.64,88.1 SV1.7 | v86.99,90.64 92.07,90.64 93.34,91.91 RN1.2
  Bottom 0.254: v70.48,85.56 69.21,84.29 53.97,84.29 52.7,83.02 IC4.10 | v86.99,90.64 70.48,90.64 69.21,89.37 69.21,88.1 SV1.7
N$5  (via drill 0.61)
  Top 0.254: v67.94,85.56 70.48,88.1 v70.48,89.37 | IC4.12 v57.78,85.56 | v93.34,88.1 93.34,89.37 95.88,91.91 RN1.3
  Bottom 0.254: v57.78,85.56 v67.94,85.56 | v70.48,89.37 83.18,89.37 | 83.18,89.37 SV1.5 | v93.34,88.1 92.07,89.37 83.18,89.37
N$6  (via drill 0.61)
  Top 0.254: v59.05,93.18 59.05,84.29 60.32,83.02 IC4.13 | v84.45,91.91 86.99,89.37 | 86.99,89.37 SV1.3 | 86.99,89.37 90.8,89.37 92.07,88.1 92.07,86.83 93.34,86.83 98.42,91.91 RN1.4
  Bottom 0.254: v59.05,93.18 83.18,93.18 v84.45,91.91
N$7  (via drill 0.61)
  Top 0.254: v83.18,77.94 88.26,83.02 88.26,86.83 SV1.1 90.8,86.83 90.8,85.56 95.88,85.56 98.42,88.1 98.42,89.37 100.96,91.91 RN1.5
  Bottom 0.254: v83.18,77.94 67.94,77.94 65.4,80.48 IC4.15
N$8  (via drill 0.61)
  Top 0.254: v70.48,71.59 70.48,84.29 66.67,84.29 62.86,88.1 IC4.3 | v102.23,75.4 106.04,79.21 112.39,79.21 v112.39,81.75
  Bottom 0.254: v70.48,71.59 71.75,70.32 86.99,70.32 90.8,74.13 100.96,74.13 v102.23,75.4 | v112.39,81.75 126.36,81.75 128.9,79.21 128.9,74.13 126.36,74.13 125.09,75.4 IC6.12
N$9  (via drill 0.61)
  Top 0.254: v48.89,63.97 51.43,66.51 51.43,74.13 52.7,75.4 IC5.6
  Bottom 0.254: IC1.47 v48.89,63.97
N$10  (via drill 0.61)
  Top 0.254: IC8.9 IC8.10 IC8.7 116.2,42.38 114.93,43.65 | IC7.1 131.44,70.32 132.71,69.05 132.71,30.95 131.44,29.68 IC9.1 | R4.1 75.56,67.78 IC10.1 | 114.93,43.65 113.66,44.92 IC11.9 | v112.39,69.05 114.93,66.51 114.93,43.65
  Bottom 0.254: IC9.1 131.44,29.68 130.17,30.95 130.17,36.03 117.47,36.03 116.2,34.76 IC8.10 | v112.39,69.05 79.37,69.05 78.1,67.78 IC10.1
N$11
  Top 0.254: IC6.4 122.55,85.56 123.82,86.83 123.82,90.64 Q1.2
  Bottom 0.254: IC6.5 IC6.4 | R3.2 122.55,90.64 Q1.2
N$12
  Top 0.254: IC6.1 130.17,85.56 128.9,86.83 128.9,90.64 Q1.1
  Bottom 0.254: R2.1 130.17,90.64 Q1.1
N$13  (via drill 0.61)
  Top 0.254: v111.12,67.78 111.12,76.67 109.85,77.94 IC12.22
  Bottom 0.254: v111.12,67.78 126.36,67.78 128.9,65.24 IC7.15
N$14
  Bottom 0.254: 127.63,86.83 R2.2 | 125.09,86.83 127.63,86.83 | R3.1 125.09,86.83 | 125.09,86.83 IC6.3 | 127.63,86.83 IC6.2
N$17  (via drill 0.61)
  Top 0.254: v74.29,14.44 74.29,18.25 80.64,24.6 v80.64,30.95 | v79.37,32.22 79.37,38.57 78.1,39.84 IC13.1
  Bottom 0.254: v74.29,14.44 55.24,14.44 53.97,13.17 IC3.19 | v80.64,30.95 v79.37,32.22
N$20  (via drill 0.61)
  Top 0.254: v69.21,63.97 v71.75,61.43 | v52.7,63.97 IC5.9
  Bottom 0.254: v52.7,63.97 v69.21,63.97 | v71.75,61.43 79.37,61.43 81.91,63.97 100.96,63.97 106.04,58.89 121.28,58.89 123.82,56.35 135.25,56.35 139.06,52.54 139.06,27.14 133.98,27.14 132.71,25.87 127.63,25.87 127.63,32.22 126.36,32.22 IC8.14
N$21  (via drill 0.61)
  Top 0.254: v121.28,37.3 122.55,36.03 122.55,30.95 123.82,29.68 IC9.4
  Bottom 0.254: v121.28,37.3 117.47,37.3 116.2,36.03 79.37,36.03 78.1,34.76 IC13.3
N$22
  Top 0.254: R1.1 LED1.K
N$23
  Top 0.254: IC9.5 121.28,27.14 122.55,25.87 128.9,25.87 IC9.2
N$24
  Bottom 0.254: IC12.13 109.85,55.08 112.39,57.62 118.74,57.62 121.28,55.08 IC11.5
N$25  (via drill 0.61)
  Top 0.254: v111.12,48.73 111.12,56.35 109.85,57.62 IC12.14
  Bottom 0.254: v111.12,48.73 114.93,48.73 116.2,47.46 IC11.10
N$26  (via drill 0.61)
  Top 0.254: v120.01,60.16 120.01,48.73 118.74,47.46 IC11.11
  Bottom 0.254: v120.01,60.16 IC12.15
N$27  (via drill 0.61)
  Top 0.254: v122.55,58.89 122.55,48.73 121.28,47.46 IC11.12
  Bottom 0.254: v122.55,58.89 120.01,61.43 111.12,61.43 109.85,62.7 IC12.16
N$28  (via drill 0.61)
  Top 0.254: v125.09,66.51 125.09,48.73 126.36,47.46 IC11.14
  Bottom 0.254: v125.09,66.51 111.12,66.51 109.85,65.24 IC12.17
N$29  (via drill 0.61)
  Top 0.254: v74.29,80.48 74.29,66.51 75.56,65.24 IC10.2
  Bottom 0.254: v74.29,80.48 89.53,80.48 90.8,79.21 106.04,79.21 107.31,80.48 IC12.23
N$30  (via drill 0.61)
  Top 0.254: v73.02,80.48 73.02,66.51 74.29,65.24 74.29,58.89 75.56,57.62 IC10.5
  Bottom 0.254: v73.02,80.48 75.56,83.02 IC12.1
N$31  (via drill 0.61)
  Top 0.254: v74.29,56.35 74.29,53.81 75.56,52.54 IC10.7 | v97.15,56.35 97.15,79.21 95.88,80.48 IC12.2
  Bottom 0.254: v74.29,56.35 v97.15,56.35
N$32  (via drill 0.61)
  Top 0.254: v89.53,53.81 89.53,75.4 92.07,77.94 IC12.3
  Bottom 0.254: v89.53,53.81 86.99,53.81 85.72,52.54 IC10.10
N$33
  Top 0.254: IC10.12 83.18,57.62 81.91,58.89 81.91,69.05 90.8,77.94 90.8,79.21 95.88,79.21 95.88,76.67 94.61,75.4 IC12.4
N$34  (via drill 0.61)
  Top 0.254: v88.26,70.32 88.26,67.78 85.72,65.24 IC10.15
  Bottom 0.254: v88.26,70.32 90.8,72.86 IC12.5
N$35  (via drill 0.61)
  Top 0.254: v111.12,28.41 111.12,19.52 112.39,18.25 114.93,18.25 114.93,25.87 116.2,27.14 IC9.7
  Bottom 0.254: v111.12,28.41 81.91,28.41 78.1,32.22 IC13.4
N$36  (via drill 0.61)
  Top 0.254: v80.64,41.11 80.64,32.22 78.1,29.68 IC13.5
  Bottom 0.254: v80.64,41.11 81.91,42.38 111.12,42.38 112.39,43.65 122.55,43.65 123.82,44.92 IC11.13
N$37
  Top 0.254: IC9.10 116.2,22.06 117.47,23.33 123.82,23.33 IC9.13
N$38  (via drill 0.61)
  Top 0.254: v88.26,20.79 88.26,19.52 79.37,19.52 75.56,15.71 75.56,5.55 59.05,5.55 53.97,10.63 53.97,14.44 52.7,15.71 IC3.18
  Bottom 0.254: v88.26,20.79 89.53,22.06 108.58,22.06 112.39,18.25 120.01,18.25 121.28,19.52 IC9.12
N$39  (via drill 0.61)
  Top 0.254: v61.59,29.68 61.59,63.97 60.32,65.24 IC5.12
  Bottom 0.254: v61.59,29.68 73.02,29.68 75.56,27.14 IC13.6
N$40  (via drill 0.61)
  Top 0.254: v66.67,61.43 62.86,65.24 IC5.13 | v86.99,58.89 86.99,25.87 v89.53,23.33
  Bottom 0.254: v66.67,61.43 67.94,60.16 73.02,60.16 74.29,58.89 v86.99,58.89 | v89.53,23.33 127.63,23.33 128.9,22.06 IC9.15
N$41  (via drill 0.61)
  Top 0.254: v70.48,46.19 70.48,56.35 67.94,58.89 IC3.40 | 92.07,44.92 95.88,41.11 95.88,36.03 97.15,34.76 IC14.3 | 92.07,44.92 v90.8,46.19 | v92.07,16.98 92.07,44.92
  Bottom 0.254: v90.8,46.19 v70.48,46.19 | v92.07,16.98 92.07,11.9 90.8,11.9 89.53,10.63 X1.9
N$42  (via drill 0.61)
  Top 0.254: v71.75,18.25 v71.75,56.35 | v93.34,16.98 93.34,25.87 97.15,29.68 IC14.5
  Bottom 0.254: v71.75,18.25 92.07,18.25 v93.34,16.98 94.61,15.71 94.61,11.9 93.34,11.9 92.07,10.63 X1.8 | v71.75,56.35 IC3.39
N$43  (via drill 0.61)
  Top 0.254: v56.51,46.19 56.51,66.51 57.78,67.78 IC5.11
  Bottom 0.254: v56.51,46.19 62.86,39.84 73.02,39.84 74.29,38.57 95.88,38.57 97.15,39.84 IC14.1
N$44
  Top 0.254: R6.2 R5.1 | IC14.6 99.69,27.14 100.96,28.41 100.96,30.95 99.69,32.22 IC14.4
  Bottom 0.254: 84.45,22.06 85.72,23.33 88.26,23.33 92.07,27.14 IC14.6 | R5.1 84.45,22.06 | 84.45,22.06 86.99,19.52 108.58,19.52 116.2,11.9 U$4.C1
N$45  (via drill 0.61)
  Top 0.254: v90.8,37.3 R5.2 90.8,16.98 v80.64,16.98
  Bottom 0.254: v90.8,37.3 IC14.2 | v80.64,16.98 88.26,9.36 93.34,9.36 94.61,10.63 X1.7
N$46
  Top 0.254: IC4.6 55.24,88.1 56.51,86.83 56.51,79.21 57.78,77.94 IC5.4
  Bottom 0.254: IC5.4 57.78,77.94 59.05,79.21 64.13,79.21 65.4,77.94 IC5.1
N$47  (via drill 0.61)
  Top 0.254: v83.18,74.13 v90.8,81.75 | v17.14,70.32 15.87,69.05 15.87,20.79 17.14,19.52 17.14,16.98 14.6,14.44 6.98,14.44 6.98,20.79 5.71,22.06 U$1.26
  Bottom 0.254: v90.8,81.75 111.12,81.75 112.39,80.48 125.09,80.48 127.63,77.94 IC6.13 | v83.18,74.13 67.94,74.13 65.4,71.59 47.62,71.59 46.35,70.32 v17.14,70.32
TPA  (via drill 0.61)
  Top 0.254: v18.41,62.7 IC2.11
  Bottom 0.254: v18.41,62.7 15.87,60.16 5.71,60.16 U$1.11
TPB  (via drill 0.61)
  Top 0.254: v15.87,19.52 9.52,25.87 v9.52,53.81
  Bottom 0.254: v15.87,19.52 55.24,19.52 59.05,15.71 IC3.23 | v9.52,53.81 6.98,56.35 5.71,56.35 U$1.12
VADDR0  (via drill 0.61)
  Top 0.254: v47.62,51.27 45.08,48.73 45.08,39.84 43.81,38.57 43.81,22.06 41.27,19.52 36.19,19.52 36.19,18.25 34.92,16.98 31.11,16.98 31.11,36.03 29.84,37.3 v29.84,53.81
  Bottom 0.254: v47.62,51.27 IC3.4 | v29.84,53.81 IC1.6
VADDR1
  Bottom 0.254: IC1.7 34.92,51.27 36.19,50 48.89,50 50.16,48.73 IC3.5
VADDR2
  Bottom 0.254: IC1.8 32.38,48.73 33.65,47.46 46.35,47.46 47.62,46.19 IC3.6
VADDR3
  Bottom 0.254: IC1.9 34.92,46.19 36.19,44.92 48.89,44.92 50.16,43.65 IC3.7
VADDR4
  Bottom 0.254: IC1.10 24.76,43.65 26.03,42.38 48.89,42.38 50.16,41.11 IC3.8
VADDR5
  Bottom 0.254: IC1.11 34.92,41.11 36.19,39.84 48.89,39.84 50.16,38.57 IC3.9
VADDR6
  Bottom 0.254: IC1.12 32.38,38.57 33.65,37.3 48.89,37.3 50.16,36.03 IC3.10
VADDR7
  Bottom 0.254: IC1.13 34.92,36.03 36.19,34.76 48.89,34.76 50.16,33.49 IC3.11
VADDR8
  Bottom 0.254: IC1.14 32.38,33.49 33.65,32.22 46.35,32.22 47.62,30.95 IC3.12
VADDR9
  Bottom 0.254: IC1.15 31.11,30.95 32.38,29.68 41.27,29.68 42.54,28.41 IC3.13
VADDR10  (via drill 0.61)
  Top 0.254: v29.84,24.6 28.57,25.87 v28.57,57.62
  Bottom 0.254: v29.84,24.6 41.27,24.6 42.54,25.87 IC3.14 | v28.57,57.62 27.3,58.89 IC1.4
VADDR11  (via drill 0.61)
  Top 0.254: v46.35,27.14 v46.35,23.33 | v33.65,27.14 32.38,28.41 v32.38,30.95 | v20.95,32.22 20.95,57.62 26.03,57.62 26.03,60.16 24.76,61.43 IC1.3
  Bottom 0.254: v33.65,27.14 v46.35,27.14 | v32.38,30.95 31.11,32.22 v20.95,32.22 | v46.35,23.33 IC3.15
VCC  (via drill 0.61)
  Top 0.254: R4.2 75.56,75.4 C1.1 79.37,69.05 v80.64,67.78 79.37,66.51 C9.1 76.83,43.65 74.29,41.11 74.29,22.06 R6.1 73.02,14.44 v70.48,11.9 | 67.94,75.4 67.94,72.86 65.4,70.32 IC5.14 | IC4.16 67.94,75.4 | 67.94,75.4 C4.1 | C6.1 102.23,46.19 104.77,46.19 104.77,39.84 IC14.14 | C7.1 59.05,61.43 v59.05,46.19 | C10.1 130.17,77.94 IC6.14 130.17,66.51 131.44,65.24 IC7.16 | LED1.A 135.25,15.71 131.44,19.52 IC9.16 | 135.25,24.6 IC9.16 | 135.25,24.6 C11.1 | IC8.16 131.44,32.22 130.17,30.95 130.17,23.33 131.44,22.06 IC9.16 | 135.25,37.3 C15.1 | 135.25,37.3 135.25,24.6 | C14.1 135.25,66.51 135.25,37.3 | v28.57,65.24 C3.1 | IC2.20 41.27,74.13 40,72.86 40,66.51 IC1.48 | C8.+ 12.06,85.56 | 12.06,85.56 12.06,80.48 C2.1 v14.6,63.97 | 12.06,85.56 5.71,85.56 U$1.1 | C5.1 81.91,93.18 RN1.1
  Bottom 0.254: v80.64,67.78 IC10.16 | C5.1 71.75,83.02 67.94,83.02 IC4.16 67.94,80.48 69.21,79.21 R4.2 | v70.48,11.9 64.13,11.9 62.86,10.63 IC3.20 | 79.37,42.38 79.37,39.84 IC13.14 85.72,39.84 86.99,41.11 103.5,41.11 104.77,39.84 IC14.14 | C9.1 79.37,42.38 | v59.05,46.19 62.86,42.38 79.37,42.38 | C14.1 133.98,67.78 131.44,65.24 IC7.16 | C12.1 135.25,51.27 131.44,47.46 IC11.16 131.44,44.92 136.52,44.92 C15.1 | IC1.48 32.38,66.51 31.11,65.24 v28.57,65.24 26.03,65.24 24.76,63.97 IC1.2 v14.6,63.97 | IC12.24 107.31,83.02 106.04,84.29 102.23,84.29 C13.1 95.88,86.83 94.61,88.1 | 94.61,88.1 90.8,91.91 RN1.1 90.8,94.45 18.41,94.45 C8.+ | C10.1 136.52,88.1 94.61,88.1
VDATA0  (via drill 0.61)
  Top 0.254: v18.41,4.28 18.41,24.6 22.22,28.41 IC1.16 | v108.58,24.6 108.58,50 v98.42,60.16
  Bottom 0.254: v18.41,4.28 20.95,1.74 131.44,1.74 139.06,9.36 139.06,24.6 v108.58,24.6 | v98.42,60.16 97.15,61.43 88.26,61.43 86.99,62.7 IC10.14
VDATA1  (via drill 0.61)
  Top 0.254: v19.68,4.28 19.68,23.33 22.22,25.87 IC1.17 | v126.36,3.01 126.36,15.71 125.09,16.98 109.85,16.98 109.85,50 v100.96,58.89
  Bottom 0.254: v19.68,4.28 20.95,3.01 v126.36,3.01 | v100.96,58.89 88.26,58.89 86.99,60.16 IC10.13
VDATA2  (via drill 0.61)
  Top 0.254: v20.95,5.55 20.95,22.06 22.22,23.33 IC1.18 | v88.26,25.87 89.53,27.14 89.53,50 v90.8,51.27
  Bottom 0.254: v20.95,5.55 70.48,5.55 75.56,10.63 75.56,16.98 64.13,16.98 64.13,19.52 75.56,19.52 81.91,25.87 v88.26,25.87 | v90.8,51.27 90.8,55.08 IC10.11
VDATA3  (via drill 0.61)
  Top 0.254: v36.19,20.79 36.19,22.06 v42.54,22.06 | v60.32,22.06 v60.32,53.81
  Bottom 0.254: v42.54,22.06 v60.32,22.06 | v60.32,53.81 61.59,55.08 IC10.6 | IC1.19 v36.19,20.79
VDATA4  (via drill 0.61)
  Top 0.254: v27.3,18.25 31.11,14.44 31.11,5.55 33.65,3.01 45.08,3.01 45.08,38.57 47.62,41.11 v47.62,47.46 | v88.26,47.46 v88.26,60.16
  Bottom 0.254: v47.62,47.46 v88.26,47.46 | v88.26,60.16 86.99,61.43 80.64,61.43 79.37,60.16 IC10.4 | v27.3,18.25 IC1.20
VDATA5  (via drill 0.61)
  Top 0.254: v14.6,15.71 6.98,23.33 6.98,69.05 8.25,70.32 9.52,70.32 v9.52,58.89
  Bottom 0.254: v9.52,58.89 13.33,55.08 59.05,55.08 66.67,62.7 IC10.3 | v14.6,15.71 IC1.21
VDATA6  (via drill 0.61)
  Top 0.254: v73.02,9.36 v74.29,8.09 | v137.79,22.06 139.06,23.33 139.06,84.29 137.79,85.56 131.44,85.56 131.44,81.75 128.9,79.21 128.9,74.13 127.63,74.13 127.63,66.51 126.36,65.24 IC7.14
  Bottom 0.254: v73.02,9.36 28.57,9.36 24.76,13.17 IC1.22 | v74.29,8.09 78.1,4.28 118.74,4.28 136.52,22.06 v137.79,22.06
VDATA7  (via drill 0.61)
  Top 0.254: v59.05,6.82 v59.05,37.3
  Bottom 0.254: v59.05,6.82 36.19,6.82 34.92,8.09 27.3,8.09 24.76,10.63 IC1.23 | v59.05,37.3 IC13.2
VROWS0  (via drill 0.61)
  Top 0.254: v89.53,51.27 90.8,52.54 90.8,63.97 92.07,65.24 IC12.8
  Bottom 0.254: v89.53,51.27 81.91,51.27 79.37,53.81 IC3.38
VROWS1  (via drill 0.61)
  Top 0.254: v73.02,51.27 v73.02,63.97
  Bottom 0.254: v73.02,63.97 79.37,63.97 81.91,66.51 90.8,66.51 92.07,67.78 IC12.7 | IC3.37 v73.02,51.27
VROWS2  (via drill 0.61)
  Top 0.254: v90.8,48.73 95.88,53.81 95.88,69.05 94.61,70.32 IC12.6
  Bottom 0.254: IC3.36 v90.8,48.73